# EAGLE design Implantable_Order5il_V2_Dec9_2022 (EAGLE 9.5.1)
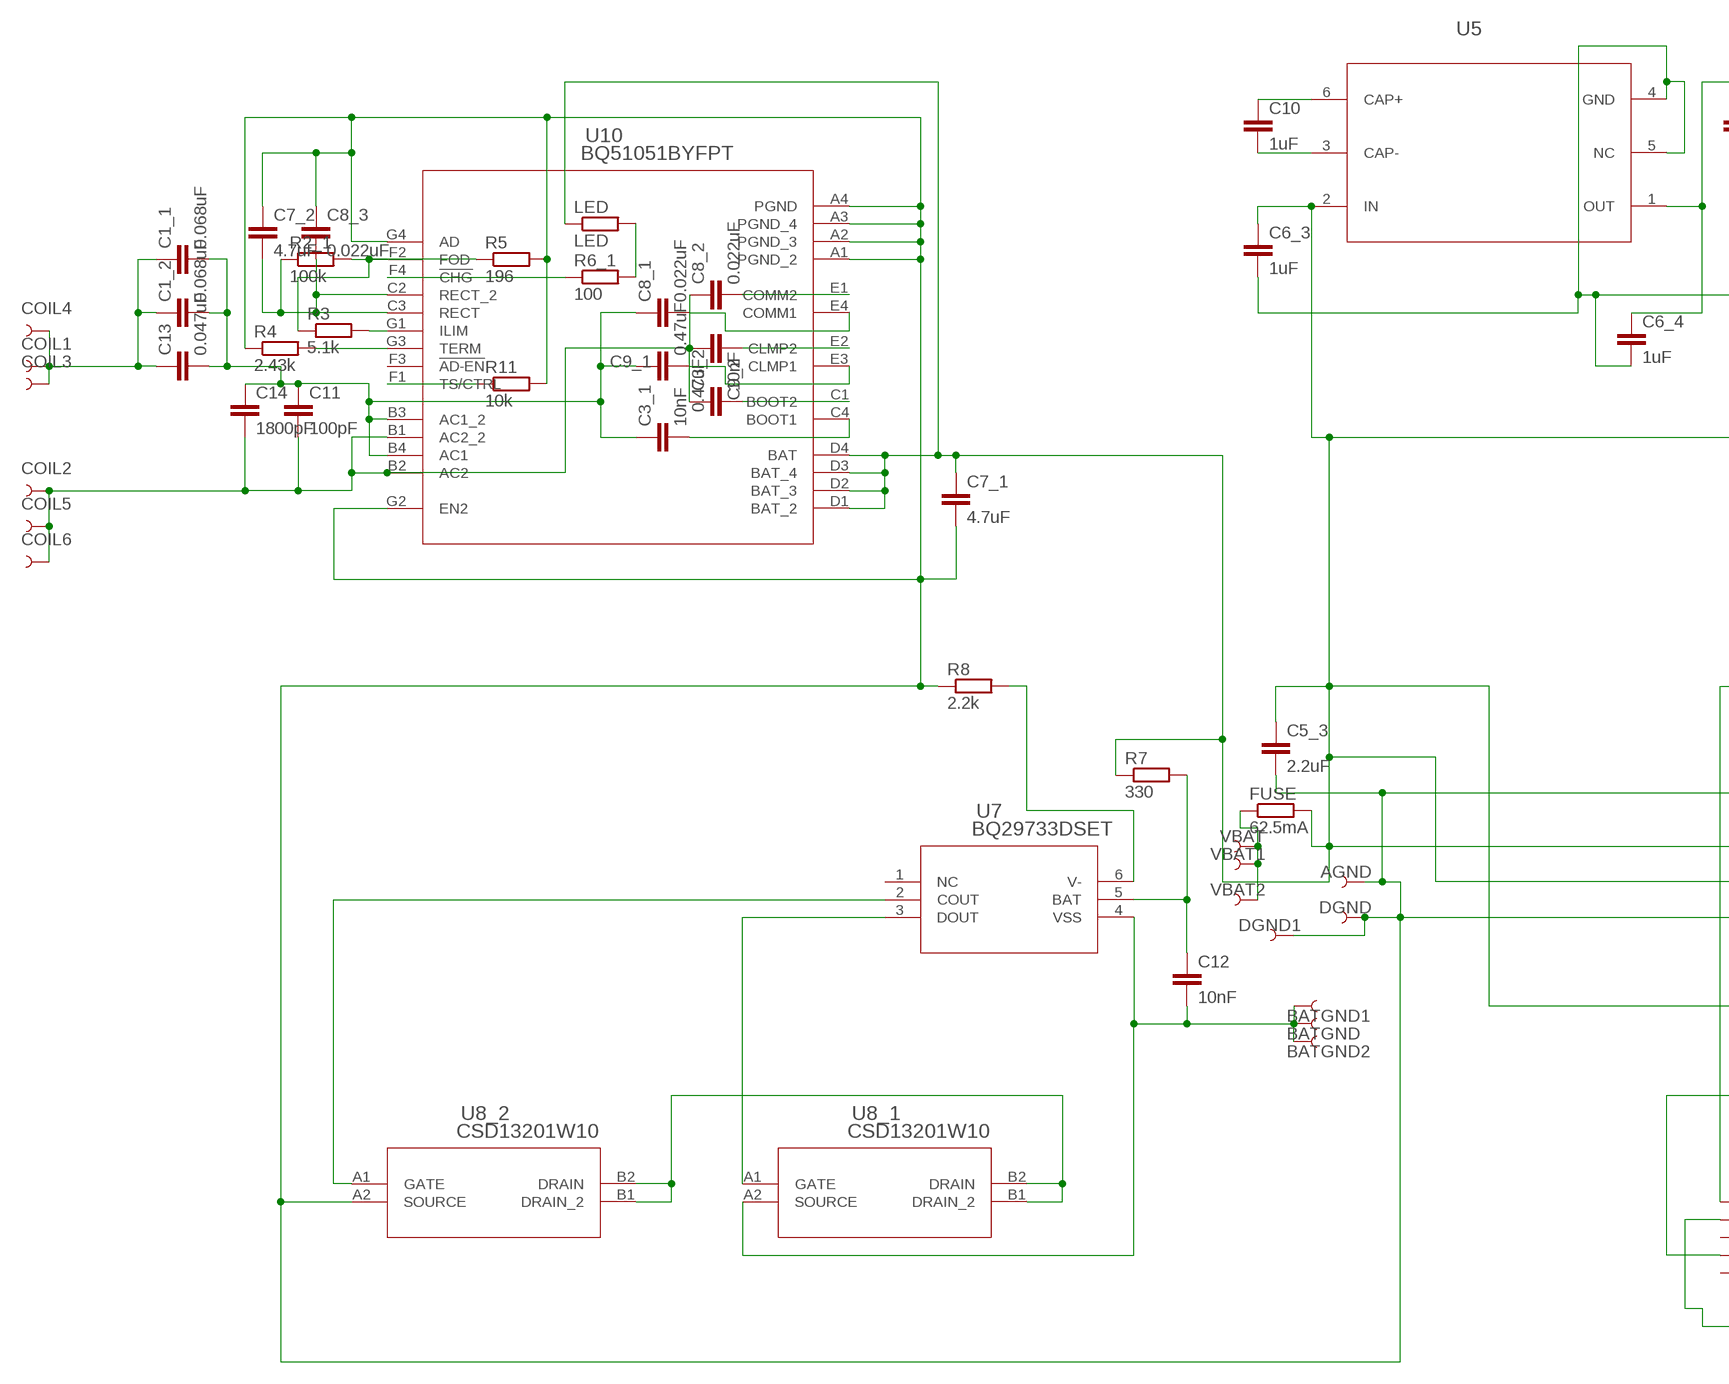
[diagram p0: schematic, sheet 1, part 1 of 2]
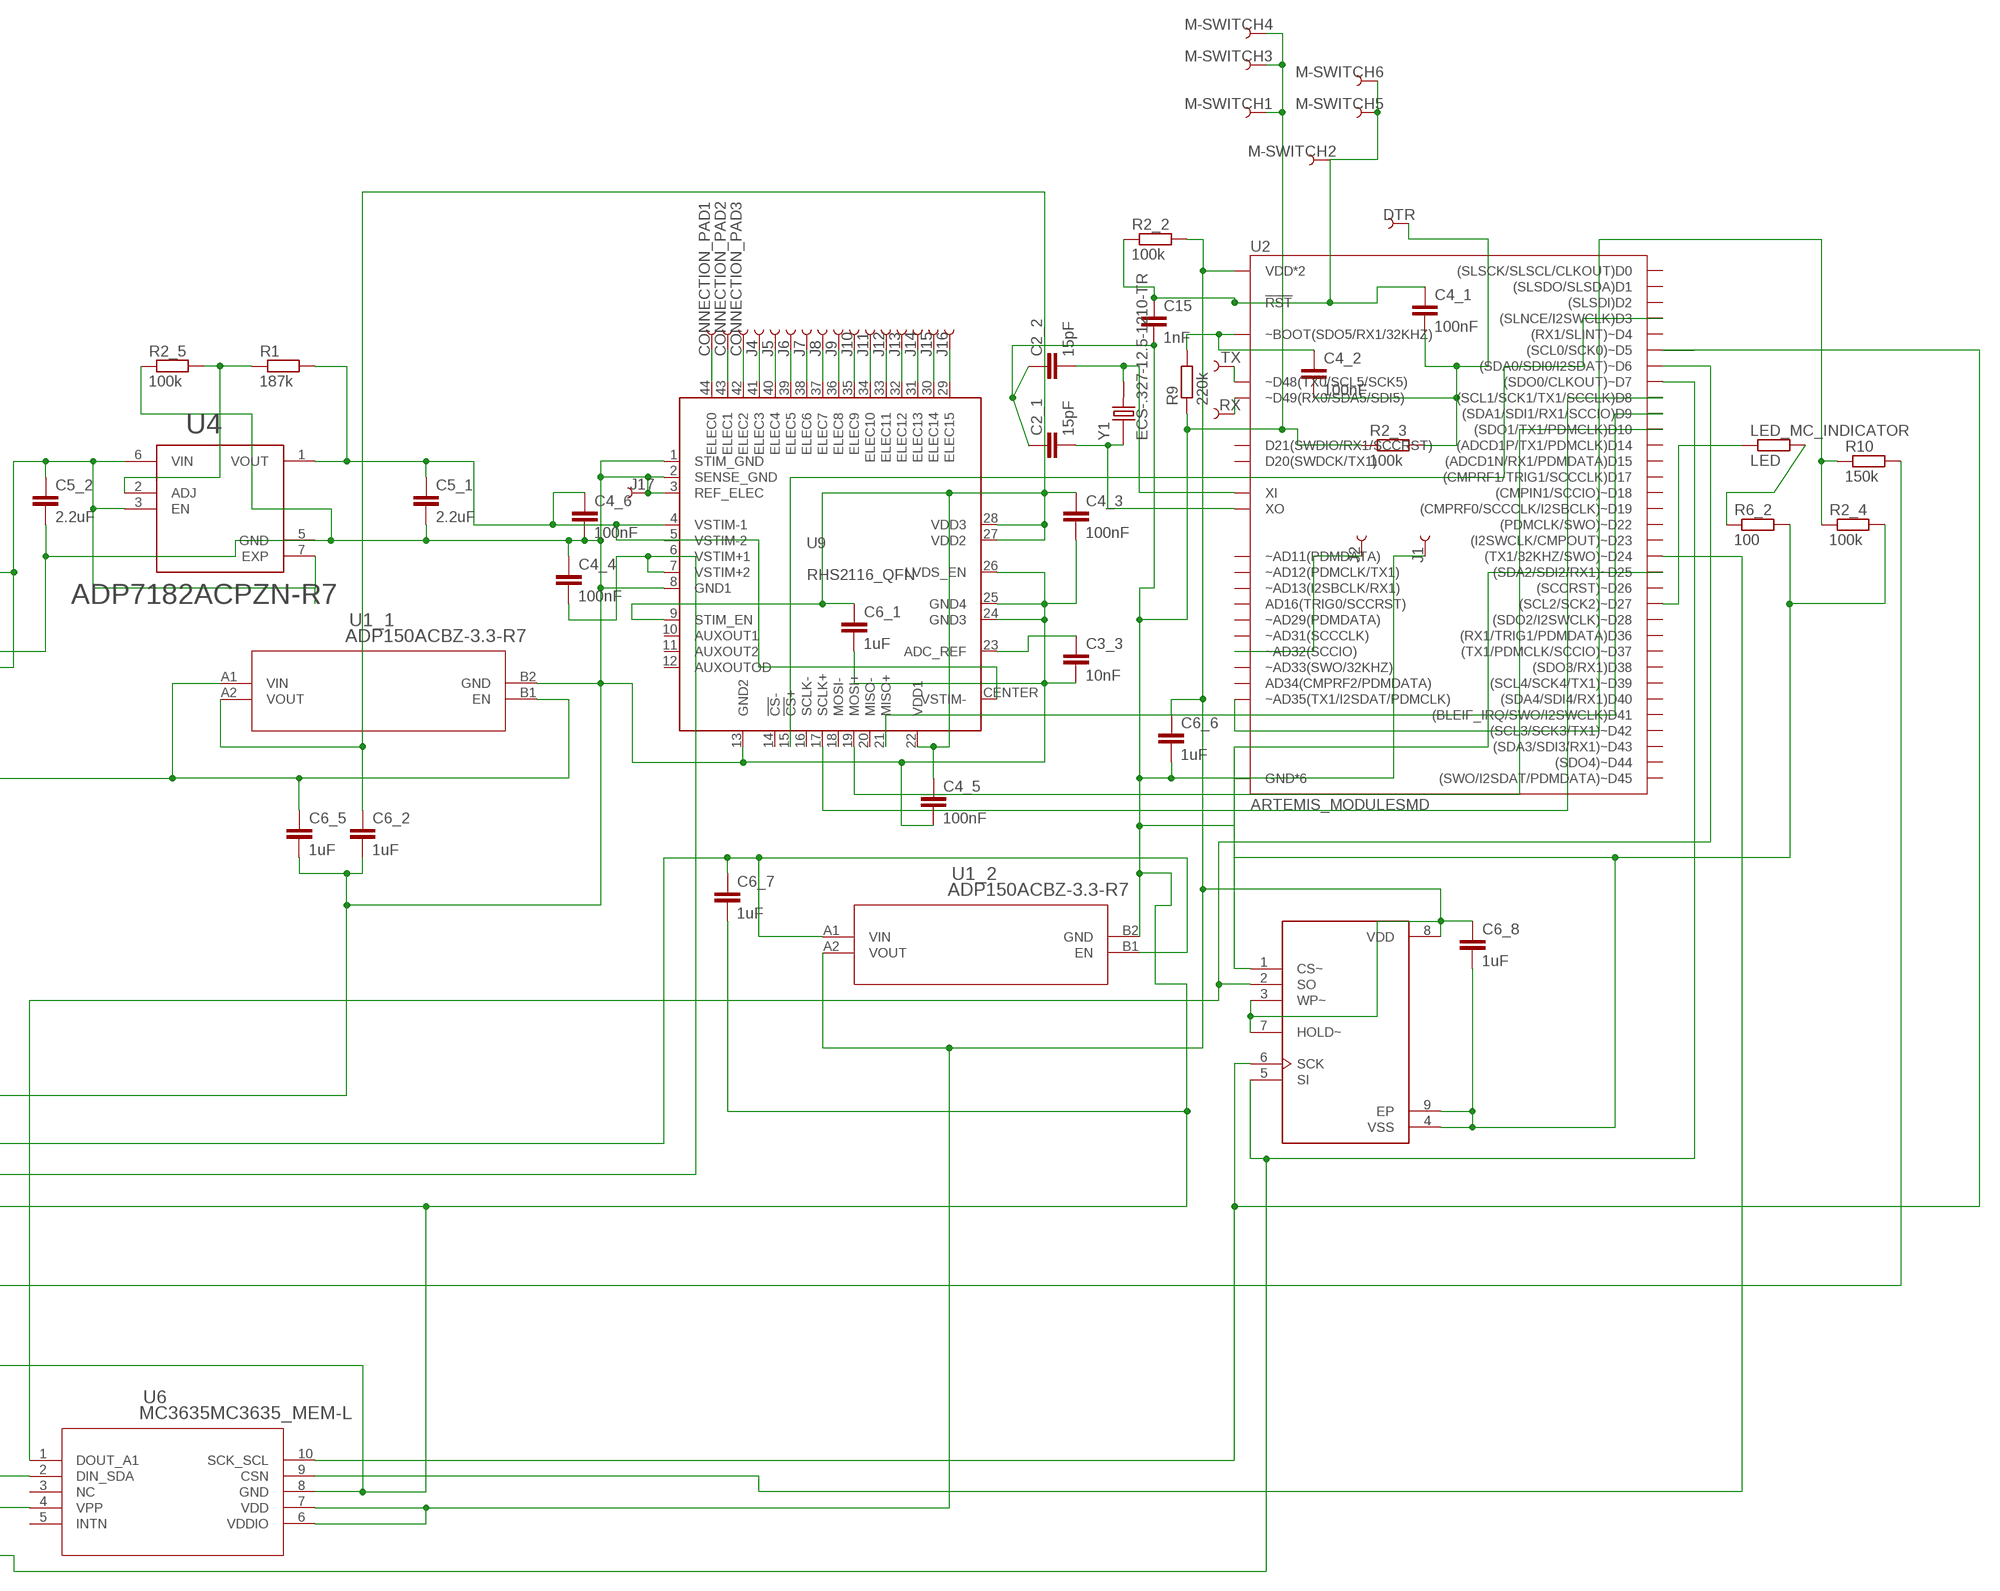
[diagram p1: schematic, sheet 1, part 2 of 2]

## Parts
AGND  PAD.4X.6  [MODULE_PAD]
BATGND  PAD.4X.6  [MODULE_PAD]
BATGND1  PAD.4X.6  [MODULE_PAD]
BATGND2  PAD.4X.6  [MODULE_PAD]
C1_1  0.068uF  C-EUC0402K  [C0402K]
C1_2  0.068uF  C-EUC0402K  [C0402K]
C2_1  15pF  C-EUC0201  [C0201]
C2_2  15pF  C-EUC0201  [C0201]
C3_1  10nF  C-EUC0201  [C0201]
C3_2  10nF  C-EUC0201  [C0201]
C3_3  10nF  C-EUC0201  [C0201]
C4_1  100nF  C-EUC0201  [C0201]
C4_2  100nF  C-EUC0201  [C0201]
C4_3  100nF  C-EUC0201  [C0201]
C4_4  100nF  C-EUC0201  [C0201]
C4_5  100nF  C-EUC0201  [C0201]
C4_6  100nF  C-EUC0201  [C0201]
C5_1  2.2uF  C-EUC0201  [C0201]
C5_2  2.2uF  C-EUC0201  [C0201]
C5_3  2.2uF  C-EUC0201  [C0201]
C6_1  1uF  C-EUC0201  [C0201]
C6_2  1uF  C-EUC0201  [C0201]
C6_3  1uF  C-EUC0201  [C0201]
C6_4  1uF  C-EUC0201  [C0201]
C6_5  1uF  C-EUC0201  [C0201]
C6_6  1uF  C-EUC0201  [C0201]
C6_7  1uF  C-EUC0201  [C0201]
C6_8  1uF  C-EUC0201  [C0201]
C7_1  4.7uF  C-EUC0402K  [C0402K]
C7_2  4.7uF  C-EUC0402K  [C0402K]
C8_1  0.022uF  C-EUC0201  [C0201]
C8_2  0.022uF  C-EUC0201  [C0201]
C8_3  0.022uF  C-EUC0201  [C0201]
C9_1  0.47uF  C-EUC0402K  [C0402K]
C9_2  0.47uF  C-EUC0402K  [C0402K]
C10  1uF  C-EUC0402K  [C0402K]
C11  100pF  C-EUC0201  [C0201]
C12  10nF  C-EUC0603  [C0603]
C13  0.047uF  C-EUC0201  [C0201]
C14  1800pF  C-EUC0402K  [C0402K]
C15  1nF  C-EUC0201  [C0201]
COIL1  PAD.4X.6  [MODULE_PAD]
COIL2  PAD.4X.6  [MODULE_PAD]
COIL3  PAD.4X.6  [MODULE_PAD]
COIL4  PAD.4X.6  [MODULE_PAD]
COIL5  PAD.4X.6  [MODULE_PAD]
COIL6  PAD.4X.6  [MODULE_PAD]
CONNECTION_PAD1  PAD.4X.6  [MODULE_PAD]
CONNECTION_PAD2  PAD.4X.6  [MODULE_PAD]
CONNECTION_PAD3  PAD.4X.6  [MODULE_PAD]
DGND  PAD.4X.6  [MODULE_PAD]
DGND1  PAD.4X.6  [MODULE_PAD]
DTR  PAD.4X.6  [MODULE_PAD]
FUSE  62.5mA  R-EU_R0402  [R0402]
J1  PAD.4X.6  [MODULE_PAD]
J2  PAD.4X.6  [MODULE_PAD]
J4  PAD.4X.6  [MODULE_PAD]
J5  PAD.4X.6  [MODULE_PAD]
J6  PAD.4X.6  [MODULE_PAD]
J7  PAD.4X.6  [MODULE_PAD]
J8  PAD.4X.6  [MODULE_PAD]
J9  PAD.4X.6  [MODULE_PAD]
J10  PAD.4X.6  [MODULE_PAD]
J11  PAD.4X.6  [MODULE_PAD]
J12  PAD.4X.6  [MODULE_PAD]
J13  PAD.4X.6  [MODULE_PAD]
J14  PAD.4X.6  [MODULE_PAD]
J15  PAD.4X.6  [MODULE_PAD]
J16  PAD.4X.6  [MODULE_PAD]
J17  PAD.4X.6  [MODULE_PAD]
LED  LED  R-EU_R0201  [R0201]
LED_MC_INDICATOR  LED  R-EU_R0201  [R0201]
M-SWITCH1  PAD.4X.6  [MODULE_PAD]
M-SWITCH2  PAD.4X.6  [MODULE_PAD]
M-SWITCH3  PAD.4X.6  [MODULE_PAD]
M-SWITCH4  PAD.4X.6  [MODULE_PAD]
M-SWITCH5  PAD.4X.6  [MODULE_PAD]
M-SWITCH6  PAD.4X.6  [MODULE_PAD]
R1  187k  R-EU_R0201  [R0201]
R2_1  100k  R-EU_R0201  [R0201]
R2_2  100k  R-EU_R0201  [R0201]
R2_3  100k  R-EU_R0201  [R0201]
R2_4  100k  R-EU_R0201  [R0201]
R2_5  100k  R-EU_R0201  [R0201]
R3  5.1k  R-EU_R0201  [R0201]
R4  2.43k  R-EU_R0201  [R0201]
R5  196  R-EU_R0201  [R0201]
R6_1  100  R-EU_R0201  [R0201]
R6_2  100  R-EU_R0201  [R0201]
R7  330  R-EU_R0201  [R0201]
R8  2.2k  R-EU_R0201  [R0201]
R9  220k  R-EU_R0201  [R0201]
R10  150k  R-EU_R0201  [R0201]
R11  10k  R-EU_R0201  [R0201]
RX  PAD.4X.6  [MODULE_PAD]
TX  PAD.4X.6  [MODULE_PAD]
U1_1  ADP150ACBZ-3.3-R7  [CB_4_3_ADI]
U1_2  ADP150ACBZ-3.3-R7  [CB_4_3_ADI]
U2  ARTEMIS_MODULESMD  [ARTEMIS_FP]
U3  MB85RC64TAPN-G-AMEWE1  [SON50P200X300X75-9N]
U4  ADP7182ACPZN-R7  [SON65P200X200X65-7N]
U5  ADM8829ARTZ-REELRJ_6_ADI-L  [RJ_6_ADI-L]
U6  MC3635MC3635_MEM-L  [MC3635_MEM-L]
U7  BQ29733DSET  [DSE6_TEX]
U8_1  CSD13201W10  [YZB4_TEX]
U8_2  CSD13201W10  [YZB4_TEX]
U9  RHS2116_QFN  [QFN44_7_X_7]
U10  BQ51051BYFPT  [YFP28]
VBAT  PAD.4X.6  [MODULE_PAD]
VBAT1  PAD.4X.6  [MODULE_PAD]
VBAT2  PAD.4X.6  [MODULE_PAD]
Y1  ECS-.327-12.5-1210-TR  [XTAL_ECS-.327-12.5-1210-TR]

## Nets
BG: BATGND1.1 BATGND2.1 BATGND.1 C12.2 U7.4(VSS) U8_1.A2(SOURCE)
BOOT: C4_2.1 R9.2 U2.BOOT(~BOOT(SDO5/RX1/32KHZ))
CS2: U2.~D25((SDA2/SDI2/RX1)~D25) U3.1(CS~)
DRT: C4_1.2 C4_2.2 DTR.1 R2_3.2
G: AGND.1 C2_1.1 C2_2.1 C3_3.2 C4_3.2 C4_4.1 C4_5.2 C4_6.2 C5_1.2 C5_2.2 C5_3.2 C6_1.2 C6_2.2 C6_3.2 C6_4.2 C6_5.2 C6_6.2 C6_7.2 C6_8.2 C7_1.2 C7_2.1 C8_3.1 C15.2 DGND1.1 DGND.1 J1.1 J17.1 M-SWITCH1.1 M-SWITCH3.1 M-SWITCH4.1 R2_3.1 R2_4.2 R2_5.1 R4.1 R5.2 R6_2.2 R8.1 R9.1 R11.2 U1_1.B2(GND) U1_2.B2(GND) U2.GND@1(GND*6) U2.GND@22(GND*6) U2.GND@38(GND*6) U2.GND@39(GND*6) U2.GND@47(GND*6) U2.GND@59(GND*6) U3.4(VSS) U3.9(EP) U4.5(GND) U5.4(GND) U5.5(NC) U6.4(VPP) U6.8(GND) U8_2.A2(SOURCE) U9.1(STIM_GND) U9.2(SENSE_GND) U9.3(REF_ELEC) U9.8(GND1) U9.13(GND2) U9.24(GND3) U9.25(GND4) U9.26(LVDS_EN) U10.A1(PGND_2) U10.A2(PGND_3) U10.A3(PGND_4) U10.A4(PGND) U10.G2(EN2) U10.G4(AD)
MISO: U2.D9((SDA1/SDI1/RX1/SCCIO)D9) U9.21(MISO+)
MOSI: U2.D10((SDO1/TX1/PDMCLK)D10) U9.19(MOSI+)
MS+: C4_1.1 C15.1 M-SWITCH2.1 M-SWITCH5.1 M-SWITCH6.1 R2_2.1 U2.~RST(!RST)
N$1: J6.1 U9.39(ELEC5)
N$2: J16.1 U9.29(ELEC15)
N$3: CONNECTION_PAD1.1 U9.44(ELEC0)
N$4: CONNECTION_PAD2.1 U9.43(ELEC1)
N$5: CONNECTION_PAD3.1 U9.42(ELEC2)
N$6: J4.1 U9.41(ELEC3)
N$7: J5.1 U9.40(ELEC4)
N$8: J7.1 U9.38(ELEC6)
N$9: J8.1 U9.37(ELEC7)
N$10: J9.1 U9.36(ELEC8)
N$11: J10.1 U9.35(ELEC9)
N$12: J11.1 U9.34(ELEC10)
N$13: J12.1 U9.33(ELEC11)
N$14: J13.1 U9.32(ELEC12)
N$15: J14.1 U9.31(ELEC13)
N$16: J15.1 U9.30(ELEC14)
N$17: R2_4.1 R10.1 U2.~AD35(~AD35(TX1/I2SDAT/PDMCLK))
N$18: C2_1.2 U2.XO Y1.1(IN/OUT)
N$19: C12.1 R7.2 U7.5(BAT)
N$20: LED_MC_INDICATOR.1 U2.~D27((SCL2/SCK2)~D27)
N$21: FUSE.1 VBAT1.1 VBAT2.1 VBAT.1
N$22: C4_6.1 C5_1.1 R1.2 U4.1(VOUT) U9.4(VSTIM-1) U9.5(VSTIM-2) U9.CENTER(VSTIM-)
N$23: U2.D3((SLNCE/I2SWCLK)D3) U9.15(!CS!+)
N$24: C2_2.2 U2.XI Y1.2(OUT/IN)
N$25: U7.3(DOUT) U8_1.A1(GATE)
N$26: J2.1 U2.~AD32(~AD32(SCCIO))
N$27: C5_2.1 C6_4.1 U4.3(EN) U4.6(VIN) U4.7(EXP) U5.1(OUT)
N$28: C3_3.1 U9.23(ADC_REF)
N$29: R1.1 R2_5.2 U4.2(ADJ)
N$30: U7.2(COUT) U8_2.A1(GATE)
N$31: TX.1 U2.TXO-0(~D48(TX0/SCL5/SCK5))
N$32: C10.1 U5.6(CAP+)
N$33: C10.2 U5.3(CAP-)
N$35: C1_1.1 C1_2.1 C13.1 COIL1.1 COIL3.1 COIL4.1
N$36: C8_2.2 U10.E1(COMM2)
N$37: U8_1.B1(DRAIN_2) U8_1.B2(DRAIN) U8_2.B1(DRAIN_2) U8_2.B2(DRAIN)
N$38: R8.2 U7.6(V-)
N$39: C7_2.2 C8_3.2 R2_1.1 U10.C2(RECT_2) U10.C3(RECT)
N$40: C3_1.2 U10.C4(BOOT1)
N$41: C9_1.2 U10.E3(CLMP1)
N$42: C8_1.2 U10.E4(COMM1)
N$43: R2_1.2 R3.1 R5.1 U10.F2(FOD)
N$44: C1_1.2 C1_2.2 C3_1.1 C8_1.1 C9_1.1 C11.1 C13.2 C14.1 U10.B3(AC1_2) U10.B4(AC1)
N$45: C9_2.1 U10.E2(CLMP2)
N$46: C3_2.2 U10.C1(BOOT2)
N$47: C3_2.1 C8_2.1 C9_2.2 C11.2 C14.2 COIL2.1 COIL5.1 COIL6.1 U10.B1(AC2_2) U10.B2(AC2)
N$49: R11.1 U10.F1(TS/CTRL)
N$50: R3.2 U10.G1(ILIM)
N$51: R4.2 U10.G3(TERM)
N$52: R6_1.1 U10.F4(!CHG)
N$53: LED.2 R6_1.2
N$54: U2.~D24((TX1/32KHZ/SWO)~D24) U6.9(CSN)
N$57: RX.1 U2.RXI-0(~D49(RX0/SDA5/SDI5))
N$59: LED_MC_INDICATOR.2 R6_2.1
SCK: U2.D8((SCL1/SCK1/TX1/SCCLK)D8) U9.17(SCLK+)
SCK2: U2.~D5((SCL0/SCK0)~D5) U3.6(SCK) U6.10(SCK_SCL)
SI: U2.D7((SDO0/CLKOUT)~D7) U3.5(SI) U6.2(DIN_SDA)
SO: U2.~D6((SDA0/SDI0/I2SDAT)~D6) U3.2(SO) U6.1(DOUT_A1)
V_INTAN: C4_3.1 C4_5.1 C6_1.1 C6_2.1 U1_1.A2(VOUT) U9.9(STIM_EN) U9.22(VDD1) U9.27(VDD2) U9.28(VDD3)
V_MC: C6_6.1 C6_8.1 R2_2.2 U1_2.A2(VOUT) U2.VDD@36(VDD*2) U2.VDD@37(VDD*2) U3.3(WP~) U3.7(HOLD~) U3.8(VDD) U6.6(VDDIO) U6.7(VDD)
VBAT: C4_4.2 C5_3.1 C6_3.1 C6_5.1 C6_7.1 C7_1.1 FUSE.2 LED.1 R7.1 R10.2 U1_1.A1(VIN) U1_1.B1(EN) U1_2.A1(VIN) U1_2.B1(EN) U5.2(IN) U9.6(VSTIM+1) U9.7(VSTIM+2) U10.D1(BAT_2) U10.D2(BAT_3) U10.D3(BAT_4) U10.D4(BAT)
Unconnected: U2.AD16(AD16(TRIG0/SCCRST)) U2.AD34(AD34(CMPRF2/PDMDATA)) U2.D0((SLSCK/SLSCL/CLKOUT)D0) U2.D1((SLSDO/SLSDA)D1) U2.D2((SLSDI)D2) U2.D14((ADCD1P/TX1/PDMCLK)D14) U2.D15((ADCD1N/RX1/PDMDATA)D15) U2.D17((CMPRF1/TRIG1/SCCCLK)D17) U2.D36((RX1/TRIG1/PDMDATA)D36) U2.D38((SDO3/RX1)D38) U2.D40((SDA4/SDI4/RX1)D40) U2.D41((BLEIF_IRQ/SWO/I2SWCLK)D41) U2.SWDCK(D20(SWDCK/TX1)) U2.SWDIO(D21(SWDIO/RX1/SCCRST)) U2.~AD11(~AD11(PDMDATA)) U2.~AD12(~AD12(PDMCLK/TX1)) U2.~AD13(~AD13(I2SBCLK/RX1)) U2.~AD29(~AD29(PDMDATA)) U2.~AD31(~AD31(SCCCLK)) U2.~AD33/SWO(~AD33(SWO/32KHZ)) U2.~D4((RX1/SLINT)~D4) U2.~D18((CMPIN1/SCCIO)~D18) U2.~D19((CMPRF0/SCCCLK/I2SBCLK)~D19) U2.~D22((PDMCLK/SWO)~D22) U2.~D23((I2SWCLK/CMPOUT)~D23) U2.~D26((SCCRST)~D26) U2.~D28((SDO2/I2SWCLK)~D28) U2.~D37((TX1/PDMCLK/SCCIO)~D37) U2.~D39((SCL4/SCK4/TX1)~D39) U2.~D42((SCL3/SCK3/TX1)~D42) U2.~D43((SDA3/SDI3/RX1)~D43) U2.~D44((SDO4)~D44) U2.~D45((SWO/I2SDAT/PDMDATA)~D45) U6.3(NC) U6.5(INTN) U7.1(NC) U9.10(AUXOUT1) U9.11(AUXOUT2) U9.12(AUXOUTOD) U9.14(!CS!-) U9.16(SCLK-) U9.18(MOSI-) U9.20(MISO-) U10.F3(!AD-EN)

## Library data of the parts
AGND BATGND BATGND1 BATGND2 COIL1-COIL6 CONNECTION_PAD1-CONNECTION_PAD3 DGND DGND1 DTR J1 J2 J4-J17 M-SWITCH1-M-SWITCH6 RX TX VBAT VBAT1 VBAT2 = Module-Pads:PAD
C1_1 C1_2 = rcl:C-EU: CAPACITOR, European symbol; DIGIKEY: 445-7346-1-ND; SPICEPREFIX: C
C2_1 C2_2 C4_1-C4_6 C6_1-C6_8 C10 C15 = rcl:C-EU: CAPACITOR, European symbol; SPICEPREFIX: C
C3_1-C3_3 = rcl:C-EU: CAPACITOR, European symbol; DIGIKEY: 587-5943-1-ND; SPICEPREFIX: C
C5_1-C5_3 = rcl:C-EU: CAPACITOR, European symbol; DIGIKEY: 490-13227-1-ND; SPICEPREFIX: C
C7_1 C7_2 = rcl:C-EU: CAPACITOR, European symbol; DIGIKEY: 1276-6836-1-ND; SPICEPREFIX: C
C8_1-C8_3 = rcl:C-EU: CAPACITOR, European symbol; DIGIKEY: 587-EMK063B7223KP-FCT-ND; SPICEPREFIX: C
C9_1 C9_2 = rcl:C-EU: CAPACITOR, European symbol; DIGIKEY: 587-3497-1-ND; SPICEPREFIX: C
C11 = rcl:C-EU: CAPACITOR, European symbol; DIGIKEY: 445-12105-1-ND; SPICEPREFIX: C
C12 = rcl:C-EU: CAPACITOR, European symbol; DIGIKEY: C0603C103J3GACTU; SPICEPREFIX: C
C13 = rcl:C-EU: CAPACITOR, European symbol; DIGIKEY: 445-13679-1-ND; SPICEPREFIX: C
C14 = rcl:C-EU: CAPACITOR, European symbol; DIGIKEY: 399-C0402C182J5RAC7867CT-ND; SPICEPREFIX: C
FUSE = rcl:R-EU_: RESISTOR, European symbol; DIGIKEY: F0402G0R06FNTR; SPICEPREFIX: R
LED = rcl:R-EU_: RESISTOR, European symbol; DIGIKEY: APG0603SEC-TT; SPICEPREFIX: R
LED_MC_INDICATOR = rcl:R-EU_: RESISTOR, European symbol; DIGIKEY: APG0603SEC-E-TT; SPICEPREFIX: R
R1 = rcl:R-EU_: RESISTOR, European symbol; DIGIKEY: 541-CRCW0201174KFNEDCT-ND; SPICEPREFIX: R
R2_1-R2_4 R3-R5 R6_1 R6_2 R7-R11 = rcl:R-EU_: RESISTOR, European symbol; SPICEPREFIX: R
R2_5 = rcl:R-EU_: RESISTOR, European symbol; DIGIKEY: 541-2941-1-ND; SPICEPREFIX: R
U1_1 U1_2 = ADP150:ADP150ACBZ-3.3-R7; COPYRIGHT: Copyright (C) 2022 Ultra Librarian. All rights reserved.; DIGI-KEY_PART_NUMBER_1: ADP150ACBZ-3.3-R7CT-ND; DIGI-KEY_PART_NUMBER_2: ADP150ACBZ-3.3-R7DKR-ND; DIGI-KEY_PART_NUMBER_3: ADP150ACBZ-3.3-R7TR-ND; DIGI-KEY_PART_NUMBER_4: 2156-ADP150ACBZ-3.3-R7-ND; MANUFACTURER_PART_NUMBER: ADP150ACBZ-3.3-R7; MFR_NAME: Analog Devices Inc
U2 = SparkFun-IC-Microcontroller:ARTEMIS_MODULE: Description: The Artemis Module from SparkFun is a Cortex-M4F with BLE 5.0 running up to 96MHz and with as low power as 6uA per MHz (less than 5mW). This is the world's first module to bridge the market between hobbyists and consumer products. We've packaged all the power of a modern microcontroller into a module that is both extremely easy to use but is mass-market ready. The flexibility of the Artemis module starts with our [Arduino core](https://github.com/sparkfun/Arduino_Apollo3). You can program and use the Artemis module just like you would an Uno or any other Arduino. Time to first blink is just 5 minutes away! We built the core from the ground up, making it fast and as light weight as possible.; PROD_ID: SUB-14402
U3 = MB85RS64T:MB85RC64TAPN-G-AMEWE1: FRAM IÂ²C 8Kx8 SON8 1.8V RoHScon; DESCRIPTION: FRAM (Ferroelectric RAM) Memory IC 64Kb (8K x 8) I²C 3.4 MHz 8-SON (2x3); MF: Fujitsu Electronics; MP: MB85RC64TAPN-G-AMEWE1; PACKAGE: SON-8 Fujitsu; PURCHASE-URL: https://pricing.snapeda.com/search/part/MB85RC64TAPN-G-AMEWE1/?ref=eda
U4 = ADP7182ACPZN-R7:ADP7182ACPZN-R7: IC REG LINEAR 200MA 6LFCSP; DESCRIPTION: Linear Voltage Regulator IC Negative Adjustable 1 Output 200mA 6-LFCSP-UD (2x2); DIGI-KEY_PART_NUMBER: 505-ADP7182ACPZN-R7TR-ND; MF: Analog Devices; MP: ADP7182ACPZN-R7; PACKAGE: LFCSP-6 Analog Devices; PURCHASE-URL: https://pricing.snapeda.com/search/part/ADP7182ACPZN-R7/?ref=eda
U5 = ADM8828:ADM8829ARTZ-REEL; COPYRIGHT: Copyright (C) 2022 Ultra Librarian. All rights reserved.; DIGI-KEY_PART_NUMBER_1: ADM8829ARTZ-REELCT-ND; DIGI-KEY_PART_NUMBER_2: ADM8829ARTZ-REELDKR-ND; DIGI-KEY_PART_NUMBER_3: ADM8829ARTZ-REELTR-ND; DIGI-KEY_PART_NUMBER_4: 2156-ADM8829ARTZ-REEL-ND; MANUFACTURER_PART_NUMBER: ADM8829ARTZ-REEL; MFR_NAME: Analog Devices Inc
U6 = MC3635:MC3635; COPYRIGHT: Copyright (C) 2022 Ultra Librarian. All rights reserved.; DIGI-KEY_PART_NUMBER_1: 2548-MC3635TR-ND; DIGI-KEY_PART_NUMBER_2: 2548-MC3635CT-ND; DIGI-KEY_PART_NUMBER_3: 2548-MC3635DKR-ND; MANUFACTURER_PART_NUMBER: MC3635; MFR_NAME: Memsic
U7 = BQ29733_2:BQ29733DSET; COPYRIGHT: Copyright (C) 2022 Ultra Librarian. All rights reserved.; DIGI-KEY_PART_NUMBER_1: BQ29733DSET-ND; DIGI-KEY_PART_NUMBER_2: 296-BQ29733DSETCT-ND; DIGI-KEY_PART_NUMBER_3: 296-BQ29733DSETDKR-ND; DIGI-KEY_PART_NUMBER_4: 296-BQ29733DSETTR-ND; MANUFACTURER_PART_NUMBER: BQ29733DSET; MFR_NAME: Texas Instruments
U8_1 U8_2 = CSD13201:CSD13201W10; COPYRIGHT: Copyright (C) 2022 Ultra Librarian. All rights reserved.; DIGI-KEY_PART_NUMBER_1: 296-41412-1-ND; DIGI-KEY_PART_NUMBER_2: 296-41412-2-ND; DIGI-KEY_PART_NUMBER_3: 296-41412-6-ND; DIGI-KEY_PART_NUMBER_4: CSD13201W10-ND; MANUFACTURER_PART_NUMBER: CSD13201W10; MFR_NAME: Texas Instruments
U9 = RHS2000:RHS2116: Intan Technologies RHS2116 chip
U10 = BQ51051:BQ51051BYFPT; COPYRIGHT: Copyright (C) 2022 Ultra Librarian. All rights reserved.; DIGI-KEY_PART_NUMBER_1: 2156-BQ51051BYFPT-ND; DIGI-KEY_PART_NUMBER_2: 296-35506-1-ND; DIGI-KEY_PART_NUMBER_3: 296-35506-2-ND; DIGI-KEY_PART_NUMBER_4: 296-35506-6-ND; DIGI-KEY_PART_NUMBER_5: 296-BQ51051BYFPTCT-ND; DIGI-KEY_PART_NUMBER_6: 296-BQ51051BYFPTDKR-ND; DIGI-KEY_PART_NUMBER_7: 296-BQ51051BYFPTTR-ND; MANUFACTURER_PART_NUMBER: BQ51051BYFPT; MFR_NAME: Texas Instruments
Y1 = ECS-.327-12.5-1210-TR:ECS-.327-12.5-1210-TR: Crystal 2-SMD, No Lead; DESCRIPTION: 32.768 kHz ±20ppm Crystal 12.5pF 90 kOhms 2-SMD, No Lead; DIGI-KEY_PART_NUMBER: XC2282TR-ND; MF: ECS Inc.; MP: ECS-.327-12.5-1210-TR; PACKAGE: SMD-2 ECS International; PURCHASE-URL: https://pricing.snapeda.com/search/part/ECS-.327-12.5-1210-TR/?ref=eda

## Net classes
1 power: width 0.178 mm
2 3.3V: width 0.508 mm

## Board
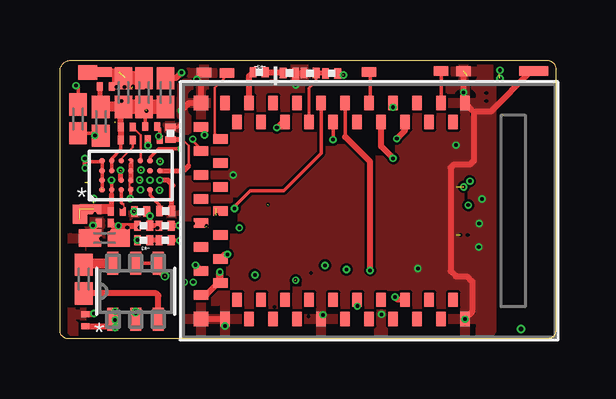
[diagram p2: board, top side]
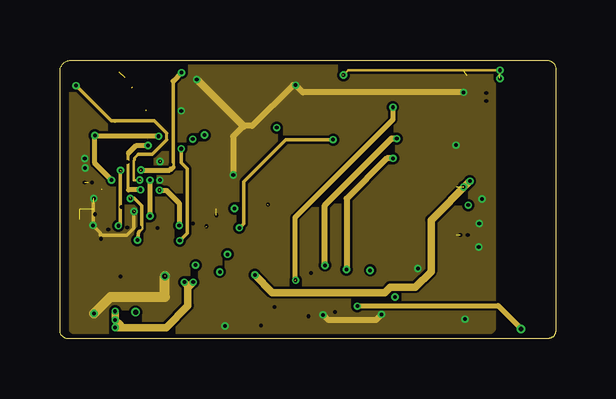
[diagram p3: board, inner layer GND]
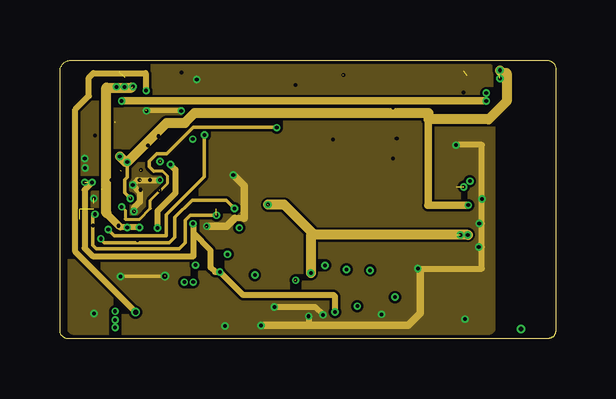
[diagram p4: board, inner layer VDD]
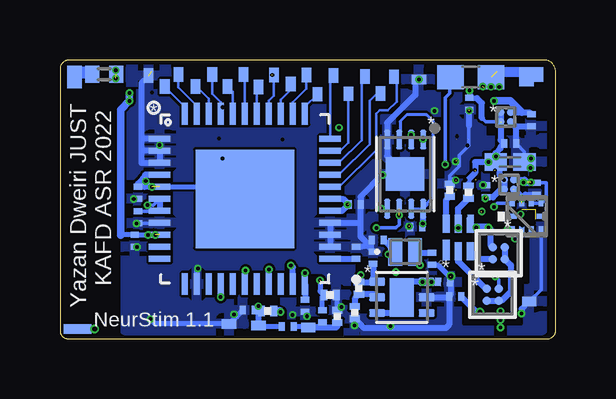
[diagram p5: board, bottom side, seen from below]

Size 20.65 x 11.61 mm. Coordinates in mm from the lower left corner, seen from the top.
Outline: 20.65,11.2 20.65,0.33 arc-90 20.33,0.01 0.47,0.01 arc-90 0,0.28 0,11.15 arc-90 0.47,11.61 20.33,11.61 arc-90 20.65,11.2
Copper layers ((1*2)+(15*16)): Top 0.035mm / dielectric 0.2mm / GND 0.035mm / dielectric 0.5mm / VDD 0.035mm / dielectric 0.2mm / Bottom 0.035mm
Design rules "SparkFun-4-layer-BGA-Extreme *": minimum track width 4mil, minimum drill 0.15mm, track to track 4mil, track to pad 4mil, pad to pad 4mil, via to via 4mil, smd to smd 0mil, copper to edge 4mil, drill to drill 4mil, minimum pad ring 3mil, minimum via ring 3mil, stop-mask expansion 4mil, vias tented up to drill 25mil, thermal gap 10mil

### Footprints (pad centres in the part's own frame; a part is rotated, then mirrored left to right if it is on the bottom)
MODULE_PAD = smd 0.6 x 0.4: 1 0,0
C0402K = smd 0.925 x 0.74: 1 -0.6,0; 2 0.6,0
C0201 = smd 0.25 x 0.35: 1 -0.25,0; 2 0.25,0
C0603 = smd 1.1 x 1: 1 -0.85,0; 2 0.85,0
R0402 = smd 0.6 x 0.7: 1 -0.5,0; 2 0.5,0
R0201 = smd 0.28 x 0.43: 1 -0.255,0; 2 0.255,0
CB_4_3_ADI = smd 0.305 x 0.305: A1 -0.2,0.2; A2 0.2,0.2; B1 -0.2,-0.2; B2 0.2,-0.2
ARTEMIS_FP = smd 0.4 x 0.6: AD16 -4,-3.7; BOOT 1.5,4.5; D0 0.5,-4.5; D1 -0.5,-4.5; D2 -1,-3.7; D3 2,-3.7; D7 -1.5,4.5; D8 -0.5,4.5; D9 2,3.7; D10 1,3.7; D14 -5,3.7; D17 -3.5,-4.5; D36 2.5,-4.5; D38 3,-3.7; D40 2.5,4.5; D41 -2.5,-4.5; GND@1 4.5,4.5; GND@39 -5.5,-4.5; GND@47 -1.5,-4.5; GND@59 4.5,-4.5; RXI-0 3.5,4.5; SWDCK 4,3.7; SWDIO 0,3.7; TXO-0 0.5,4.5; ~AD31 -3,-3.7; ~AD35 -2,3.7; ~D4 -2.5,4.5; ~D5 -1,3.7; ~D18 -4.5,-4.5; ~D19 -5,-3.7; ~D22 -3.5,4.5; ~D23 -4,3.7; ~D24 -3,3.7; ~D27 -4.5,4.5; ~D28 -5.5,4.5; ~D37 3.5,-4.5; ~D39 3,3.7; ~D42 1.5,-4.5; ~D43 1,-3.7; ~D44 4,-3.7; ~D45 -2,-3.7; ~RST 0,-3.7 | smd 0.6 x 0.4: AD34 -6.5,-0.5; D15 -6.5,0.5; VDD@36 -5.7,-3; VDD@37 -6.5,-3.5; XI -6.5,-2.5; XO -5.7,-2; ~AD11 -5.7,-1; ~AD12 -5.7,2; ~AD13 -5.7,1; ~AD29 -6.5,-1.5; ~AD32 -5.7,3; ~AD33/SWO -5.7,0; ~D6 -6.5,3.5; ~D25 -6.5,2.5; ~D26 -6.5,1.5 | smd 0.6 x 0.6: GND@22 -6.5,4.5; GND@38 -6.5,-4.5
SON50P200X300X75-9N = smd 0.83 x 0.27: 1 -1.44,0.75; 2 -1.44,0.25; 3 -1.44,-0.25; 4 -1.44,-0.75; 5 1.44,-0.75; 6 1.44,-0.25; 7 1.44,0.25; 8 1.44,0.75 | smd 1.4 x 1.6: 9 0,0
SON65P200X200X65-7N = smd 0.66 x 0.32: 1 -1.03,0.65; 2 -1.03,0; 3 -1.03,-0.65; 4 1.03,-0.65; 5 1.03,0; 6 1.03,0.65 | smd 1 x 1.6: 7 0,0
RJ_6_ADI-L = smd 0.965 x 0.457: 1 -1.168,0.95; 2 -1.168,0; 3 -1.168,-0.95; 4 1.168,-0.95; 5 1.168,0; 6 1.168,0.95
MC3635_MEM-L = smd 0.254 x 0.203: 1 -0.546,0.6; 2 -0.546,0.2; 3 -0.546,-0.2; 4 -0.546,-0.6; 6 0.546,-0.6; 7 0.546,-0.2; 8 0.546,0.2; 9 0.546,0.6 | smd 0.203 x 0.254: 5 0,-0.546; 10 0,0.546
DSE6_TEX = smd 0.85 x 0.28: 1 -0.525,0.5 | smd 0.75 x 0.28: 2 -0.575,0; 3 -0.575,-0.5; 4 0.575,-0.5; 5 0.575,0; 6 0.575,0.5
YZB4_TEX = smd 0.35 x 0.35: A1 -0.25,0.25; A2 0.25,0.25; B1 -0.25,-0.25; B2 0.25,-0.25
QFN44_7_X_7 = smd 0.9 x 0.25: 1 -3.55,2.5; 2 -3.55,2; 3 -3.55,1.5; 4 -3.55,1; 5 -3.55,0.5; 6 -3.55,0; 7 -3.55,-0.5; 8 -3.55,-1; 9 -3.55,-1.5; 10 -3.55,-2; 11 -3.55,-2.5; 23 3.55,-2.5; 24 3.55,-2; 25 3.55,-1.5; 26 3.55,-1; 27 3.55,-0.5; 28 3.55,0; 29 3.55,0.5; 30 3.55,1; 31 3.55,1.5; 32 3.55,2; 33 3.55,2.5 | smd 0.25 x 0.9: 12 -2.5,-3.55; 13 -2,-3.55; 14 -1.5,-3.55; 15 -1,-3.55; 16 -0.5,-3.55; 17 0,-3.55; 18 0.5,-3.55; 19 1,-3.55; 20 1.5,-3.55; 21 2,-3.55; 22 2.5,-3.55; 34 2.5,3.55; 35 2,3.55; 36 1.5,3.55; 37 1,3.55; 38 0.5,3.55; 39 0,3.55; 40 -0.5,3.55; 41 -1,3.55; 42 -1.5,3.55; 43 -2,3.55; 44 -2.5,3.55 | smd 4.1 x 4.1: CENTER 0,0
YFP28 = smd 0.229 x 0.229: A1 -0.6,1.2; A2 -0.2,1.2; A3 0.2,1.2; A4 0.6,1.2; B1 -0.6,0.8; B2 -0.2,0.8; B3 0.2,0.8; B4 0.6,0.8; C1 -0.6,0.4; C2 -0.2,0.4; C3 0.2,0.4; C4 0.6,0.4; D1 -0.6,0; D2 -0.2,0; D3 0.2,0; D4 0.6,0; E1 -0.6,-0.4; E2 -0.2,-0.4; E3 0.2,-0.4; E4 0.6,-0.4; F1 -0.6,-0.8; F2 -0.2,-0.8; F3 0.2,-0.8; F4 0.6,-0.8; G1 -0.6,-1.2; G2 -0.2,-1.2; G3 0.2,-1.2; G4 0.6,-1.2
XTAL_ECS-.327-12.5-1210-TR = smd 0.575 x 1.14: 1 -0.412,0; 2 0.412,0

### Placement (x,y rotation side)
AGND  1.1,1.56 0 bottom
BATGND  1.21,11.12 0 bottom
BATGND1  1.21,10.72 0 bottom
BATGND2  0.71,11.02 270 bottom
C1_1  2.65,10.26 270 top
C1_2  3.5,10.26 270 top
C2_1  7.42,4.12 0 bottom
C2_2  5.15,3.33 90 bottom
C3_1  2.78,8.28 0 top
C3_2  2.37,5.31 0 top
C3_3  8.32,3.59 90 bottom
C4_1  11.16,0.52 0 bottom
C4_2  9.72,0.95 270 bottom
C4_3  8.38,5.6 0 bottom
C4_4  17.4,5.06 90 bottom
C4_5  10.44,1.38 270 bottom
C4_6  17.4,6.09 270 bottom
C5_1  7.61,3.37 90 bottom
C5_2  4.65,2.37 357.6 bottom
C5_3  1.9,8.14 0 bottom
C6_1  17.54,4.08 270 bottom
C6_2  1.01,9.11 270 bottom
C6_3  4.19,1.76 180 bottom
C6_4  1.05,0.78 90 top
C6_5  3.6,9.79 270 bottom
C6_6  5.8,4.66 180 bottom
C6_7  2.9,6.14 90 bottom
C6_8  0.8,6.26 270 bottom
C7_1  1.9,7.37 0 bottom
C7_2  1.85,4.2 0 top
C8_1  2.78,8.82 0 top
C8_2  3.9,8.31 179.7 top
C8_3  1.86,4.82 0 top
C9_1  4.4,10.26 90 top
C9_2  0.75,9.16 270 top
C10  0.99,2.49 270 top
C11  3.81,8.84 0 top
C12  3.54,10.9 0 bottom
C13  1.9,10.51 180 top
C14  1.7,9.06 270 top
C15  12.78,1.2 180 bottom
COIL1  1.85,11.11 180 top
COIL2  0.83,5.39 180 top
COIL3  1.35,11.09 90 top
COIL4  0.95,11.1 90 top
COIL5  0.83,4.99 0 top
COIL6  1.41,5.39 0 top
CONNECTION_PAD1  16.29,10.51 270 bottom
CONNECTION_PAD2  15.72,11.01 270 bottom
CONNECTION_PAD3  15,10.51 270 bottom
DGND  13.61,0.62 0 bottom
DGND1  16.82,11.15 0 top
DTR  10.31,0.48 0 bottom
FUSE  18.81,11.02 0 bottom
J1  6,11.09 0 top
J2  6.95,11.07 0 top
J4  14.31,11.01 270 bottom
J5  13.67,10.51 270 bottom
J6  13,11.01 270 bottom
J7  12.38,10.49 270 bottom
J8  11.74,10.99 270 bottom
J9  11.04,10.61 270 bottom
J10  10.39,10.99 270 bottom
J11  9.92,10.19 270 bottom
J12  9.25,10.97 270 bottom
J13  8.63,10.21 270 bottom
J14  7.94,10.93 270 bottom
J15  7.3,10.23 270 bottom
J16  6.73,10.92 270 bottom
J17  16.96,10.97 270 bottom
LED  3.48,4.11 0 top
LED_MC_INDICATOR  8.3,11.11 0 top
M-SWITCH1  5.7,10.81 0 bottom
M-SWITCH2  12.39,0.55 0 bottom
M-SWITCH3  20.05,11.16 0 top
M-SWITCH4  19.44,11.16 0 top
M-SWITCH5  19.66,0.41 0 bottom
M-SWITCH6  20.2,0.41 0 bottom
R1  8.2,2.11 90 bottom
R2_1  3.48,4.71 0 top
R2_2  12,1.16 0 bottom
R2_3  9.1,0.94 270 bottom
R2_4  10.42,11.07 180 top
R2_5  8.37,1.09 90 bottom
R3  4.38,4.71 0 top
R4  4.6,8.56 270 top
R5  3.36,5.3 180 top
R6_1  4.38,4.11 180 top
R6_2  9.56,11.08 0 top
R7  3.63,6.11 270 bottom
R8  4.41,6.2 270 bottom
R9  9.4,1.83 180 bottom
R10  11.32,11.06 0 top
R11  4.4,5.33 0 top
RX  15.88,11.16 0 top
TX  12.87,11.12 0 top
U1_1  2.08,9.24 0 bottom
U1_2  1.94,6.43 0 bottom
U2  12.38,5.33 0 top
U3  6.27,6.86 270 bottom
U4  6.41,1.73 0 bottom
U5  3.15,1.98 90 top
U6  1.21,5.1 90 bottom
U7  4.06,4.23 90 bottom
U8_1  2.37,3.57 90 bottom
U8_2  2.63,1.84 0 bottom
U9  12.95,5.83 0 bottom
U10  2.95,6.81 90 top
VBAT  20.05,11.17 0 bottom
VBAT1  20.05,10.65 0 bottom
VBAT2  20.05,10.89 0 bottom
Y1  6.27,3.62 0 bottom

### Tracks (layer width: path | path; a pad name or v marks a point on that pad's centre or on a via)
BG  (via drill 0.15 layers 15-16)  (2 unrouted)
  VDD 0.254: 2.45,4.72 2.44,4.72 2.52,4.64 v2.8,4.64 v3.31,4.64
  VDD 0.305: 2.45,4.72 1.93,5.24
  VDD 0.406: 1.93,5.24 1.93,10.47 2.98,10.47
  Bottom 0.152: 3.4,4.69 3.34,4.64 v3.31,4.64 | v3.04,10.51 2.69,10.86 C12.2 v2.69,10.5
  Bottom 0.254: U8_1.A2 2.72,3.92 2.72,4.58 2.83,4.69 3.4,4.69 3.44,4.69 U7.4 | v2.35,10.5 2.69,10.84 C12.2 | BATGND2.1 0.81,11.12 BATGND.1 BATGND1.1
  Bottom 0.406: 2.45,11.12 BATGND.1
BOOT  (via drill 0.15, 0.15 layers 1-2)  (1 unrouted)
  Top 0.305: U2.BOOT v13.88,9.66 v13.87,9.65
  GND 0.2: v13.87,9.65 13.87,9.13 9.79,5.05 9.79,2.43
  Bottom 0.152: v9.82,2.44 v9.81,2.44
  Bottom 0.2: R9.2 9.81,1.99 v9.81,2.44
  Bottom 0.203: C4_2.1 9.72,1.77 R9.2
CS2  (via drill 0.15 pad 0.3)
  Top 0.127: v5.53,8.32 5.53,8.25 5.88,7.9 U2.~D25
  Bottom 0.254: v5.53,8.32 U3.1
DRT
  Bottom 0.203: DTR.1 9.87,0.48 9.84,0.51 | 9.84,0.51 C4_1.2 | C4_2.2 9.72,0.63 9.84,0.51
  Bottom 0.254: DTR.1 9.15,0.48 9.1,0.53 R2_3.2
G  (via drill 0.15, 0.15 layers 1-2, 0.15 layers 15-16, 0.15 pad 0.2, 0.15 pad 0.3, 0.15 pad 0.3 layers 1-2, 0.15 pad 0.3 layers 15-16, 0.2)  (9 unrouted)
  Top 0.102: 5.96,11.07 M-SWITCH1.1 5.98,11.09 J1.1 | U2.GND@59 v16.88,0.82
  Top 0.152: 1.75,6.18 U10.A1 U10.A2 U10.A3 U10.A4 1.71,7.37 1.03,7.37 | C8_3.1 1.61,4.73 v1.38,4.73 1.38,4.5 1.25,4.37 C7_2.1 | v5.05,9.5 5.05,8.99 4.88,8.82 R4.1 | v1.03,7.51 1.03,7.37 | v1.05,7.12 1,7.17 1,7.37 1.03,7.37 | U2.GND@47 10.88,0.92 v10.96,1 | U5.5 U5.4
  Top 0.2: C8_3.1 1.36,4.58 | R11.2 4.66,6.45 | v4.16,6.61 4.49,6.61 4.66,6.45 | 4.71,6.4 4.66,6.45
  Top 0.203: U2.GND@39 v6.88,0.53
  Top 0.254: v1.42,1.06 1.39,1.03 C6_4.2 | v4.37,2.61 4.1,2.88 U5.4 | M-SWITCH1.1 5.88,10.63 U2.GND@22 5.38,9.83 v5.05,9.5 | U2.GND@38 U2.GND@39 | 17.24,9.47 U2.GND@1 16.82,9.89 v16.82,10.27 DGND1.1 | 17.24,9.47 17.24,7.42 17.08,7.26 16.41,7.26 16.28,7.13 16.28,2.82 16.5,2.6 16.96,2.6 17.18,2.38 17.18,1.13 U2.GND@59 | M-SWITCH4.1 M-SWITCH3.1 19.64,11.16 17.95,9.47 17.24,9.47 | R6_2.2 R2_4.2
  Top 0.305: v9.82,10.57 R6_2.2
  GND 0.152: v3.08,5.31 3.08,4.61 2.78,4.31 1.68,4.31 1.68,4.42 v1.38,4.72 v1.38,4.73 1.38,5.82 v1.41,5.85
  GND 0.254: v7.22,6.83 v7.21,6.84 7.21,8.44 7.63,8.86 7.64,8.87 8.01,8.87 9.71,10.57 v9.82,10.57 10.12,10.27 v16.82,10.27 | v13.4,1.02 13.16,0.78 11.18,0.78 v10.96,1
  GND 0.305: M-SWITCH1.1 7.63,8.88 7.63,8.86
  GND 0.406: v1.42,1.06 2.1,1.74 4.37,1.74 v4.37,2.61
  VDD 0.15: v17.45,3.83 17.58,3.83 | v17.47,4.81 17.58,4.81
  VDD 0.152: v2.52,2.6 v2.53,2.61 v4.37,2.61
  VDD 0.203: v5.05,9.5 v3.6,9.5
  VDD 0.254: v14.91,2.93 17.58,2.93 17.58,3.83 17.58,4.81 v17.58,5.83 17.58,8.08 v16.51,8.08 v16.5,8.07 | v10.36,0.94 10.36,0.56 | 7.68,5.02 7.28,5.02 | v8.93,1.33 10.23,1.33 10.23,1.34 10.62,1.34 v10.96,1 | v4.16,6.61 3.23,6.61 v3.03,6.41 3.32,6.12 3.32,5.71 3.08,5.46 v3.08,5.31
  VDD 0.305: v8.38,0.56 10.36,0.56 14.5,0.56 15,1.06 15,2.84 v14.91,2.93 | v7.22,6.83 7.68,6.37 7.68,5.02 | 7.28,5.02 6.95,4.69 v6.11,4.69
  Bottom 0.102: C5_2.2 4.4,2.57 | C2_1.1 7.64,4.15 7.65,4.15 7.84,3.97
  Bottom 0.127: 4.39,2.65 4.39,2.61
  Bottom 0.15: C6_1.2 v17.45,3.83 | C4_4.1 v17.47,4.81
  Bottom 0.152: C4_4.1 16.52,4.81 U9.8 | 4.02,7.29 4.02,7.65 3.62,8.05 3.62,8.89 | 4.02,7.29 4.02,7.19 4.41,6.8 R8.1 | C5_3.2 1.3,7.79 C7_1.2 v1.05,7.12 | v2.52,2.6 2.38,2.46 U8_2.A2 | v4.17,7.39 4.07,7.29 4.02,7.29 | U9.2 v16.5,8.07 U9.1 | 7.64,4.15 7.64,3.65 C5_1.2 | U6.4 0.61,2.05 AGND.1
  Bottom 0.203: R2_3.1 9.1,1.79 R9.1 | C15.2 13.3,0.93 DGND.1 16.68,0.62 v16.88,0.82 | v6.88,0.53 6.88,0.45 | C2_2.1 4.91,3.08 4.4,2.57
  Bottom 0.254: U1_1.B2 1.7,8.86 1.66,8.86 | 1.66,8.86 C6_2.2 | 1.66,8.86 C5_3.2 | C6_5.2 3.62,9.52 3.62,8.89 | AGND.1 1.42,1.24 v1.42,1.06 | U4.5 4.47,1.73 C6_3.2 | v4.37,2.61 v4.38,2.6 4.38,1.82 C6_3.2 | C5_1.2 7.61,3.64 7.88,3.91 8.14,3.84 C3_3.2 | v4.37,2.61 | U9.24 U9.25 U9.26 8.2,4.83 8.13,4.9 | 8.13,4.9 C4_3.2 8.13,5.92 v7.22,6.83 | 8.13,4.9 8.13,4.26 7.84,3.97 | C6_3.2 4.44,0.59 4.58,0.45 6.88,0.45 7.99,0.45 R2_5.1 v8.37,0.57 v8.38,0.56 | v14.91,2.93 14.95,2.89 U9.13 | v10.36,0.94 10.36,1.05 C4_5.2 | C6_8.2 1.25,6.01 v1.41,5.85 1.41,5.92 1.72,6.23 U1_2.B2 | U3.9 7.02,7.61 U3.4 7.02,9 5.85,10.17 5.85,10.66 M-SWITCH1.1 | v13.4,1.02 13.31,0.93 13.3,0.93 | R2_3.1 8.96,1.33 v8.93,1.33 | v4.16,6.61 4.26,6.61 R8.1 | C6_7.2 2.92,6.41 v3.03,6.41 | C4_6.2 v17.58,5.83 | v4.37,2.61 4.4,2.58 C5_2.2 | J17.1 17.26,10.67 17.26,8.32 | 17.26,8.32 17.26,7.83 | 17.26,7.83 17.26,7.33 U9.3 U9.2 17.26,7.83 | U9.1 17.25,8.33 17.26,8.32
  Bottom 0.305: v7.22,6.83 6.3,6.83 U3.9 | C6_6.2 6.07,4.66
  other vias: 5.7,10.81
  pour Bottom: 0.55,11.21 17.94,11.21 17.94,0.38 17.96,0.36 0.55,0.36
  pour Top: 0.5,11.22 0.5,0.32 17.96,0.32 17.98,0.34 17.98,11.22
  pour VDD: 0.5,11.27 0.5,0.41 0.53,0.38 17.91,0.38 17.94,0.41 17.94,11.23 0.56,11.23
  pour GND: 0.57,11.19 0.57,0.41 17.94,0.41 17.96,0.43 17.96,11.19 17.94,11.21 0.59,11.21 0.55,11.25
MISO  (via drill 0.15, 0.15 layers 1-2)
  Top 0.254: v14.03,8.34 14.38,8.69 U2.D9
  GND 0.254: v11.04,3.06 11.04,5.57 13.81,8.34 v14.03,8.34
  Bottom 0.254: U9.21 10.95,2.97 v11.04,3.06
MOSI  (via drill 0.15, 0.15 layers 1-2)
  Top 0.254: v13.88,7.52 13.38,8.02 U2.D10
  GND 0.254: v13.88,7.52 13.62,7.52 11.94,5.84 v11.94,2.89
  Bottom 0.254: U9.19 v11.95,2.88 v11.94,2.89
MS+  (via drill 0.15 pad 0.3, 0.2)
  Top 0.254: U2.~RST v12.39,1.36
  GND 0.2: v12.39,1.36 12.41,1.38 18.25,1.38 v19.21,0.42 v19.21,0.41
  Bottom 0.2: v19.21,0.41 19.18,0.41 | M-SWITCH6.1 v19.21,0.41 | M-SWITCH5.1 v19.21,0.41
  Bottom 0.203: M-SWITCH2.1 12.36,0.52 C4_1.1
  Bottom 0.254: M-SWITCH2.1 12.39,1.03 R2_2.1 12.49,1.16 C15.1 12.39,1.34 v12.39,1.36
N$1
  Bottom 0.102: J6.1 12.95,10.96 U9.39
N$2
  Bottom 0.102: U9.29 9.38,6.36 8.99,6.36 7.47,7.87 7.47,9.39 7.33,9.53 6.99,9.53 6.63,9.89 6.63,10.82 J16.1
N$3
  Bottom 0.102: U9.44 15.45,9.67 CONNECTION_PAD1.1
N$4
  Bottom 0.102: U9.43 14.95,9.71 15.72,10.48 CONNECTION_PAD2.1
N$5
  Bottom 0.102: U9.42 14.45,10.01 14.95,10.51 CONNECTION_PAD3.1
N$6
  Bottom 0.102: U9.41 13.95,9.86 14.31,10.22 J4.1
N$7
  Bottom 0.102: U9.40 13.45,10.29 J5.1
N$8
  Bottom 0.102: U9.38 12.45,10.42 J7.1
N$9
  Bottom 0.102: U9.37 11.95,9.91 11.74,10.12 J8.1
N$10
  Bottom 0.102: U9.36 11.45,9.96 11.04,10.37 J9.1
N$11
  Bottom 0.102: U9.35 10.95,9.86 10.39,10.42 J10.1
N$12
  Bottom 0.102: U9.34 10.45,9.66 J11.1
N$13
  Bottom 0.102: U9.33 9.4,10.82 J12.1
N$14
  Bottom 0.102: U9.32 8.98,7.83 8.65,8.16 8.65,10.19 J13.1
N$15
  Bottom 0.102: U9.31 9.03,7.33 8.09,8.27 8.09,10.78 J14.1
N$16
  Bottom 0.102: U9.30 9.03,6.83 7.75,8.11 7.75,9.91 7.43,10.23 J15.1
N$17
  Top 0.127: U2.~AD35 10.38,10.46 10.68,10.76 R2_4.1
  Top 0.203: R10.1 R2_4.1
N$18  (via drill 0.15)
  Top 0.254: U2.XO 6.87,3.52 v6.98,3.52
  Bottom 0.254: C2_1.2 6.68,3.64 Y1.1 6.88,3.62 v6.98,3.52
N$19  (via drill 0.15 layers 15-16)
  VDD 0.254: v4.6,7.26 4.81,7.05 4.81,6.07 4.06,5.32 v4.06,4.62
  Bottom 0.152: v4.59,7.27 v4.6,7.27 v4.6,7.26 v4.6,7.27 4.6,10.06 4.42,10.24 C12.1 | U7.5 v4.06,4.62
  Bottom 0.254: U7.5 4.06,5.43 R7.2
N$20
  Top 0.254: U2.~D27 7.88,10.95 LED_MC_INDICATOR.1
N$21
  Bottom 0.254: 19.99,11.11 VBAT.1 20.07,11.15 20.07,10.91 VBAT2.1 20.02,10.86 20.02,10.68 VBAT1.1
  Bottom 0.508: 19.99,11.11 19.4,11.11 FUSE.1
N$22  (via drill 0.15)  (1 unrouted)
  GND 0.305: v17.08,6.57 15.46,4.95 15.46,2.8 14.81,2.15 13.76,2.15 13.54,1.93 8.85,1.93 v8.12,2.66
  Bottom 0.152: v17.08,6.57 16.84,6.33 v16.83,6.33 U9.5 16.19,6.33
  Bottom 0.2: 17.12,6.83 17.08,6.79 v17.08,6.57 17.14,6.51 17.14,6.33 | v8.12,2.66 8.2,2.58 R1.2 | 16.19,6.33 13.26,6.33 | 13.26,6.33 13.22,6.37 13.74,6.89 | 13.26,6.33 13.37,6.22 13.37,5.41 | U9.CENTER 13.37,5.41 | 13.37,5.41 13.37,5.07
  Bottom 0.254: R1.2 7.46,2.37 U4.1 7.61,2.55 C5_1.1 | 17.12,6.83 U9.4 17.05,6.83 17.4,6.48 C4_6.1 17.14,6.33 v16.83,6.33
N$23  (via drill 0.15)
  Top 0.254: U2.D3 14.07,1.63 v13.96,1.74
  Bottom 0.254: U9.15 v13.96,1.74
N$24  (via drill 0.15)
  Top 0.254: U2.XI v5.65,3.07
  Bottom 0.254: C2_2.2 5.82,3.58 Y1.2 5.86,3.28 v5.65,3.07
N$25
  Bottom 0.254: U7.3 3.24,3.34 2.63,3.34 U8_1.A1
N$26
  Top 0.102: U2.~AD32 6.45,8.56 6.45,10.47 6.82,10.84 6.92,10.94 6.95,10.97 J2.1
N$27  (via drill 0.15 pad 0.3)
  Top 0.127: U5.1 2.27,0.82 v2.3,0.78 | U5.1 2.3,0.72 v2.3,0.47 | U5.1 2.3,0.92 v2.3,1.15
  Top 0.254: C6_4.1 1.92,0.53 U5.1
  GND 0.305: v2.3,0.47 2.5,0.47 | 2.5,0.47 4.42,0.47 5.33,1.38 5.33,2.21 | 5.33,2.21 v5.18,2.36 | v5.55,2.36 5.4,2.21 5.33,2.21 | 2.5,0.47 2.5,0.58 v2.3,0.78 v2.3,1.15
  Bottom 0.127: U4.6 5.36,2.36 v5.18,2.36
  Bottom 0.152: C5_2.1 U4.6
  Bottom 0.254: U4.3 6.28,1.08 6.21,1.15 6.21,1.53 U4.7 6.41,2.19 6.22,2.38 U4.6
N$28
  Bottom 0.254: U9.23 C3_3.1
N$29
  Bottom 0.254: U4.2 7.57,1.86 R1.1 8.37,1.69 R2_5.2
N$30
  Bottom 0.254: U8_2.A1 2.92,2.09 4.06,3.23 U7.2
N$31
  Top 0.152: U2.TXO-0 12.93,9.88 12.93,11.06 TX.1
N$32
  Top 0.406: C10.1 1.05,3.15 U5.6
N$33
  Top 0.254: U5.3 4.1,1.79 4.11,1.8 4.02,1.89 C10.2
N$35
  Top 0.152: COIL1.1 1.87,11.13 2.48,11.13 | C1_1.1 2.3,10.51 C13.1
  Top 0.2: C13.1 2.29,10.65 2.29,11.11 2.29,11.13
  Top 0.254: 2.48,11.13 2.29,11.13 | COIL4.1 1.33,11.11 COIL3.1 1.83,11.09 COIL1.1
  Top 0.305: COIL1.1 2.29,11.11
  Top 0.61: C1_2.1 C1_1.1
N$36  (via drill 0.15 pad 0.3 layers 1-2)  (1 unrouted)
  Top 0.2: C8_2.2 | C8_2.2 3.65,8.06 v3.67,8.06
  GND 0.127: 2.85,6.21 2.85,7.73
  GND 0.2: U10.E1 2.85,6.21 | 2.85,7.73 3.18,8.06 v3.67,8.06
  other vias: 3.35,6.21
N$37
  Bottom 0.254: U8_1.B2 U8_1.B1 1.87,3.07 1.87,1.97 2.25,1.59 U8_2.B2 U8_2.B1
N$38
  Bottom 0.254: U7.6 4.56,5.8 R8.2
N$39  (via drill 0.15 pad 0.3 layers 1-2)  (1 unrouted)
  Top 0.152: v2.43,4.71 2.43,4.4 2.42,4.39 2.29,4.26
  Top 0.2: v2.52,7.02 2.52,6.64 U10.C2 | 2.42,4.39 2.51,4.29 2.93,4.71 R2_1.1
  Top 0.254: v2.43,4.71 2.43,4.4 2.51,4.32 | R2_1.1 2.22,4.71 C8_3.2 2.29,4.64 2.29,4.32 2.33,4.32 C7_2.2
  GND 0.152: v2.52,7.02 2.52,4.8 v2.43,4.71
N$40
  Top 0.102: C3_1.2 3.03,7.99 2.55,7.51 U10.C4
N$41  (via drill 0.15 pad 0.3 layers 1-2)  (1 unrouted)
  Top 0.254: v5.06,11.09 4.83,10.86 C9_1.2
  GND 0.15: 4.71,10.74 4.71,7.17
  GND 0.2: v3.37,7.03 4.57,7.03 4.71,7.17 | v5.06,11.09 4.71,10.74
N$42
  Top 0.102: U10.E4 3.36,7.51 3.36,8.49 C8_1.2
  Top 0.152: U10.E4 3.36,7.51
N$43  (via drill 0.15 pad 0.3 layers 1-2)
  Top 0.152: v3.75,5.12 3.75,5.14 3.66,5.23 3.69,5.23 | R3.1 4.05,4.71
  Top 0.2: 4.05,4.71 R2_1.2 3.73,5.13 3.61,5.25 R5.1 3.69,5.23
  GND 0.2: v3.75,5.12 U10.F2
  other vias: 3.75,6.61
N$44
  Top 0.152: C14.1 1.65,9.66 | 3.71,9.46 C1_2.2 3.56,9.6 C11.1 | U10.B3 U10.B4 2.15,7.51 2.53,7.89 C3_1.1
  Top 0.2: C13.2 1.65,9.66 | 2.53,9.57 2.62,9.66
  Top 0.254: C3_1.1 C8_1.1 2.53,9.57 | C1_1.2 2.62,9.66
  Top 0.406: 2.62,9.66 C14.1
  Top 0.61: C1_1.2 C1_2.2 C9_1.1
N$45  (via drill 0.15 pad 0.3 layers 1-2)  (1 unrouted)
  Top 0.152: v0.67,10.55 0.75,10.47 C9_2.1
  GND 0.102: v3.32,6.62 3.07,6.62 3.07,7.42 3.1,7.45
  GND 0.127: 3.1,7.45 3.1,7.53 3.27,7.7 | 4.44,8.31 4.44,8.58
  GND 0.152: 4.44,8.58 3.93,9.1 2.13,9.1 v0.67,10.55 | v3.32,6.62 | 3.27,7.7 3.84,7.7 4.44,8.31
N$46
  Top 0.15: U10.C1 2.55,5.67 2.62,5.6 C3_2.2
N$47  (via drill 0.15 pad 0.2 layers 1-2, 0.15 pad 0.3 layers 1-2)  (3 unrouted)
  Top 0.102: C8_2.1 4.15,8.4 v4.11,8.44
  Top 0.152: U10.B2 U10.B1 2.15,6.01 | C11.2 4.15,8.75 C8_2.1 | C9_2.2 1.6,8.56 C14.2 v1.46,8.46 v1.45,8.47
  Top 0.2: 2.15,6.01 2.15,5.34 C3_2.1 2.04,5.39
  Top 0.254: COIL5.1 0.83,5.17 0.72,5.28 0.72,5.11 COIL5.1
  Top 0.406: 2.04,5.39 COIL2.1
  GND 0.2: U10.B2 1.45,7.31 v1.45,8.47 4.08,8.47 v4.11,8.44
  other vias: 2.15,6.61
N$49
  Top 0.15: R11.1 4.15,5.59 3.75,5.99 U10.F1
N$50  (via drill 0.15 pad 0.3 layers 1-2)  (1 unrouted)
  Top 0.2: v4.97,4.72 v4.96,4.71 R3.2
  GND 0.2: v4.15,6.19 4.42,6.19 4.97,5.64 v4.97,4.72
N$51
  Top 0.102: 5.36,7.22 5.36,8.06 5.11,8.31
  Top 0.2: U10.G3 5.15,7.01 5.36,7.22 | 5.11,8.31 R4.2
N$52  (via drill 0.15 pad 0.3 layers 1-2)
  Top 0.152: U10.F4 3.75,7.56 4.11,7.92 v5.05,7.92 | v4.99,4.09 4.97,4.11 R6_1.1
  GND 0.152: v5.05,7.92 5.05,7.34 5.3,7.09 5.3,4.41 v4.99,4.09
N$53
  Top 0.2: R6_1.2 LED.2
N$54  (via drill 0.15, 0.15 layers 15-16)
  Top 0.2: v9.03,8.8 9.26,9.03 U2.~D24
  VDD 0.127: v2.57,5.5 2.71,5.36 2.71,4.99 3.32,4.99 3.77,5.44 3.77,5.77 4.49,6.49 4.49,6.78 4.28,6.99 3.9,6.99
  VDD 0.15: v9.03,8.8 9.01,8.82 5.56,8.82 4.46,7.72 4.03,7.72 3.84,7.53 3.71,7.39 3.71,7.18 3.9,6.99
  Bottom 0.15: U6.9 2.42,5.65 v2.57,5.5
N$57
  Top 0.152: RX.1 U2.RXI-0
N$59
  Top 0.254: R6_2.1 8.59,11.08 LED_MC_INDICATOR.2
SCK  (via drill 0.15)
  Top 0.152: 11.88,8.42 U2.D8
  Top 0.254: v12.92,2.85 12.92,7.38 11.88,8.42
  Bottom 0.254: v12.92,2.85 12.95,2.82 U9.17
SCK2  (via drill 0.15 layers 15-16, 0.15 pad 0.2, 0.15 pad 0.2 layers 1-2)  (1 unrouted)
  Top 0.152: U2.~D5 v11.38,8.3
  GND 0.152: v11.38,8.3 9.4,8.3 7.65,6.55 7.65,4.8 v7.47,4.63
  VDD 0.152: v6.52,5.15 5.43,5.15 5.21,4.94 5.21,4 4.97,3.76 1.51,3.76 1.37,3.89 1.37,5.19 v1.46,5.19
  Bottom 0.152: v7.47,4.63 6.65,4.63 6.53,4.75 U3.6 | v1.46,5.19 1.67,5.19 U6.10
SI  (via drill 0.15 layers 15-16, 0.15 pad 0.3)
  Top 0.152: U2.D7 10.88,7.73 9.33,6.18 7.92,6.18 7.27,5.54 v7.27,5.43
  VDD 0.152: v7.27,5.43 6.92,5.78 5.5,5.78 4.78,5.06 4.78,4.24 4.55,4.01 1.85,4.01 v1.69,4.17 v1.7,4.17
  Bottom 0.152: v7.27,5.43 U3.5 | v1.7,4.17 1.41,4.46 U6.2
SO  (via drill 0.15 layers 15-16, 0.15 pad 0.2)
  Top 0.2: U2.~D6 6.04,8.67 6.04,8.51 v6.02,8.49
  VDD 0.152: v6.02,8.49 6.02,6.76 4.43,5.17 4.43,4.29 2.26,4.29 2.01,4.54 v2.01,4.56
  Bottom 0.152: v2.01,4.56 v2,4.56 U6.1
  Bottom 0.2: v6.02,8.49 U3.2
V_INTAN  (via drill 0.15 pad 0.3 layers 15-16)  (2 unrouted)
  VDD 0.305: v2.57,9.91 v17.76,9.91
  VDD 0.406: v16.99,4.33 10.48,4.33 | 10.48,4.33 10.54,4.39 9.34,5.59 v8.67,5.59 | 10.48,4.33 10.45,4.3 v10.45,2.74
  Bottom 0.152: U9.22 v10.45,2.74
  Bottom 0.2: U9.9 v16.99,4.33 C6_1.1
  Bottom 0.203: C6_1.1 18.11,4.33 18.12,4.32
  Bottom 0.254: U1_1.A2 1.42,9.44 1.09,9.44 C6_2.1 | U9.28 8.86,5.83 C4_3.1 8.9,5.33 U9.27 | U9.22 C4_5.1
  Bottom 0.305: v2.57,9.91 1.89,9.91 1.42,9.44 | 18.12,4.32 18.12,9.55 v17.76,9.91 v17.76,10.24
  other vias: 16.68,4.33
V_MC  (via drill 0.15 layers 15-16, 0.15 pad 0.3, 0.15 pad 0.3 layers 15-16)  (1 unrouted)
  Top 0.254: U2.VDD@37 6.1,1.83 6.6,2.33 U2.VDD@36
  Top 0.305: U2.VDD@36 6.66,2.35 v6.66,2.79
  VDD 0.127: v1.34,6.52 v1.03,6.52
  VDD 0.254: v1.34,6.52 1.03,6.21 1.03,3.78 1.36,3.45 5.57,3.45 5.57,4.39 | 5.57,4.39 6.27,3.69 6.27,2.98 6.46,2.79 v6.66,2.79 7.62,1.83 11.4,1.83 11.46,1.77 v11.46,1.12 | v5.54,4.8 5.57,4.77 5.57,4.39
  Bottom 0.127: U3.7 U3.8 5.36,5.59 5.36,5.67 5.1,5.93 5.1,9.06 5.38,9.33 6.21,9.33 6.49,9.06 6.49,8.34 U3.3 | v1.03,6.52 v1.03,6.51 | v1.34,6.52 v1.34,6.51
  Bottom 0.15: C6_8.1 0.39,6.51 0.39,5.83 0.57,5.65 U6.6 U6.7
  Bottom 0.152: v5.54,4.8 v5.55,4.79 C6_6.1
  Bottom 0.254: U1_2.A2 1.29,6.63 1.18,6.52 | v1.34,6.51 v1.03,6.51 C6_8.1 | C6_6.1 5.52,4.69 U3.8
  Bottom 0.305: v11.46,1.12 11.5,1.16 R2_2.2
VBAT  (via drill 0.15, 0.15 layers 1-2, 0.15 layers 15-16, 0.15 pad 0.3, 0.15 pad 0.3 layers 1-2, 0.2)  (4 unrouted)
  Top 0.102: R10.2 11.74,11.06 v11.81,10.99
  Top 0.152: U10.D1 2.95,5.87 v2.93,5.85
  Top 0.2: U10.D4 U10.D3 U10.D2 U10.D1
  Top 0.254: U5.2 v3.15,1.11
  GND 0.102: v18.33,10.85 v18.33,11.19 12,11.19 v11.81,11
  GND 0.152: LED.1 3.28,4.46 3.41,4.59 3.41,5.54 3.1,5.85 v2.93,5.85
  VDD 0.152: v2.8,7.36 2.8,6.74 2.69,6.64 2.69,6.09 v2.93,5.85
  VDD 0.254: v3.15,1.11 0.64,3.62 0.64,9.56 1.2,10.12 1.2,10.88 1.39,11.07 3.56,11.07 3.59,11.04 v3.59,10.34
  VDD 0.305: 15.35,9.4 15.35,9.14 15.35,5.58 15.33,5.56 v17,5.56 v17.01,5.57
  VDD 0.406: v18.33,11.19 18.44,11.08 18.61,11.08 18.61,9.89 17.86,9.14 15.35,9.14 | 15.35,9.4 5.6,9.4 5.2,9 4.44,9 v2.8,7.36 2.73,7.36 v2.49,7.6
  Bottom 0.152: C4_4.2 16.75,5.31 | 16.75,5.31 16.52,5.31 U9.7 | U1_1.B1 2.92,9.04 3.08,9.2 | 16.75,5.31 v17.01,5.57 16.76,5.57 U9.6
  Bottom 0.254: 2.29,9.01 2.29,8.28 C5_3.1 2.3,7.99 2.3,7.94 2.5,7.74 C7_1.1 | C7_1.1 2.35,7.22 2.35,6.84 U1_2.A1 U1_2.B1 2.28,6.23 2.62,5.89 C6_7.1 | R7.1 3.63,6.64 3.36,6.91 3.36,7.37 C7_1.1 | U9.6 U9.7 | U1_1.A1 U1_1.B1 | 3.08,9.2 3.08,9.82 3.29,10.03 C6_5.1 v3.59,10.34 | v3.15,1.11 3.28,1.11 C6_3.1
  other vias: 3.23,4.11

### Text on the board
tPlace: - | > | - | - | - | | | | | * | > | - | - | - | *
bPlace: * | * | * | * | * | * | * | * | *
bNames: Yazan Dweiri JUST / KAFD ASR 2022 | NeurStim 1.1
tDocu: |
bDocu: . | . | . | . | . | . | . | . | . | .